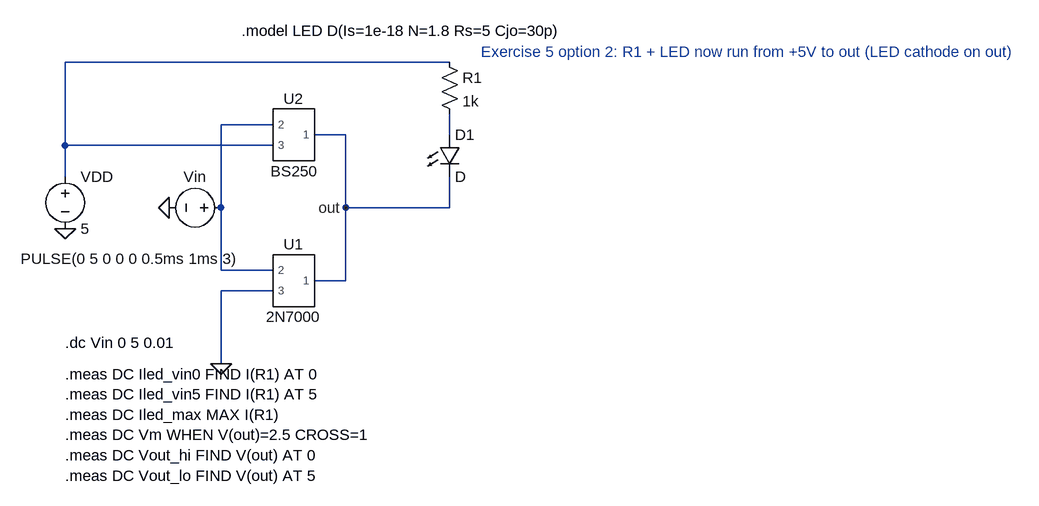
[diagram p0: schematic circuit_ex5_opt2_dc.asc]
circuit_ex5_opt2_dc.asc, the LTspice schematic file:
Version 4.1
SHEET 1 1216 680
WIRE -240 16 -320 16
WIRE -128 32 -176 32
WIRE -240 48 -560 48
WIRE -560 96 -560 48
WIRE -320 144 -320 16
WIRE -128 144 -128 32
WIRE -128 192 -128 144
WIRE -320 240 -320 144
WIRE -240 240 -320 240
WIRE -128 256 -128 192
WIRE -128 256 -176 256
WIRE -240 272 -320 272
WIRE -320 384 -320 272
WIRE 32 -80 -560 -80
WIRE -560 -80 -560 48
WIRE 32 0 32 32
WIRE 32 96 32 144
WIRE 32 144 -128 144
FLAG -320 384 0
FLAG -400 144 0
FLAG -560 176 0
FLAG -128 144 out
SYMBOL 2N7000 -208 256 M0
SYMATTR InstName U1
SYMBOL BS250 -208 32 M0
SYMATTR InstName U2
SYMBOL voltage -304 144 R90
WINDOW 0 -32 56 VBottom 2
WINDOW 3 94 157 VBottom 2
WINDOW 123 0 0 Left 0
WINDOW 39 0 0 Left 0
SYMATTR InstName Vin
SYMATTR Value PULSE(0 5 0 0 0 0.5ms 1ms 3)
SYMBOL voltage -560 80 R0
WINDOW 123 0 0 Left 0
WINDOW 39 0 0 Left 0
SYMATTR InstName VDD
SYMATTR Value 5
SYMBOL res 16 -96 R0
SYMATTR InstName R1
SYMATTR Value 1k
SYMBOL LED 16 32 R0
SYMATTR InstName D1
TEXT -288 -128 Left 2 !.model LED D(Is=1e-18 N=1.8 Rs=5 Cjo=30p)
TEXT -560 352 Left 2 !.dc Vin 0 5 0.01
TEXT -560 400 Left 2 !.meas DC Iled_vin0 FIND I(R1) AT 0\n.meas DC Iled_vin5 FIND I(R1) AT 5\n.meas DC Iled_max MAX I(R1)\n.meas DC Vm WHEN V(out)=2.5 CROSS=1\n.meas DC Vout_hi FIND V(out) AT 0\n.meas DC Vout_lo FIND V(out) AT 5
TEXT 80 -96 Left 2 ;Exercise 5 option 2: R1 + LED now run from +5V to out (LED cathode on out)

The netlist it stands for:
* circuit_ex5_opt2_dc.asc
X§U1 out N001 0 2N7000  ; pins 1 2 3
X§U2 out N001 N002 BS250  ; pins 1 2 3
Vin N001 0 PULSE(0 5 0 0 0 0.5ms 1ms 3)
VDD N002 0 5
R1 N002 N003 1k
D1 N003 out D
.model D D
.lib standard.dio
.model LED D(Is=1e-18 N=1.8 Rs=5 Cjo=30p)
.dc Vin 0 5 0.01
.meas DC Iled_vin0 FIND I(R1) AT 0
.meas DC Iled_vin5 FIND I(R1) AT 5
.meas DC Iled_max MAX I(R1)
.meas DC Vm WHEN V(out)=2.5 CROSS=1
.meas DC Vout_hi FIND V(out) AT 0
.meas DC Vout_lo FIND V(out) AT 5
* Exercise 5 option 2: R1 + LED now run from +5V to out (LED cathode on out)
.lib 2N7000.onsemi.lib
.lib BS250.philips.lib
.backanno
.end